# Altium project Tracker-NB-IOT-v1.0.PrjPcb (part 1 of 2)
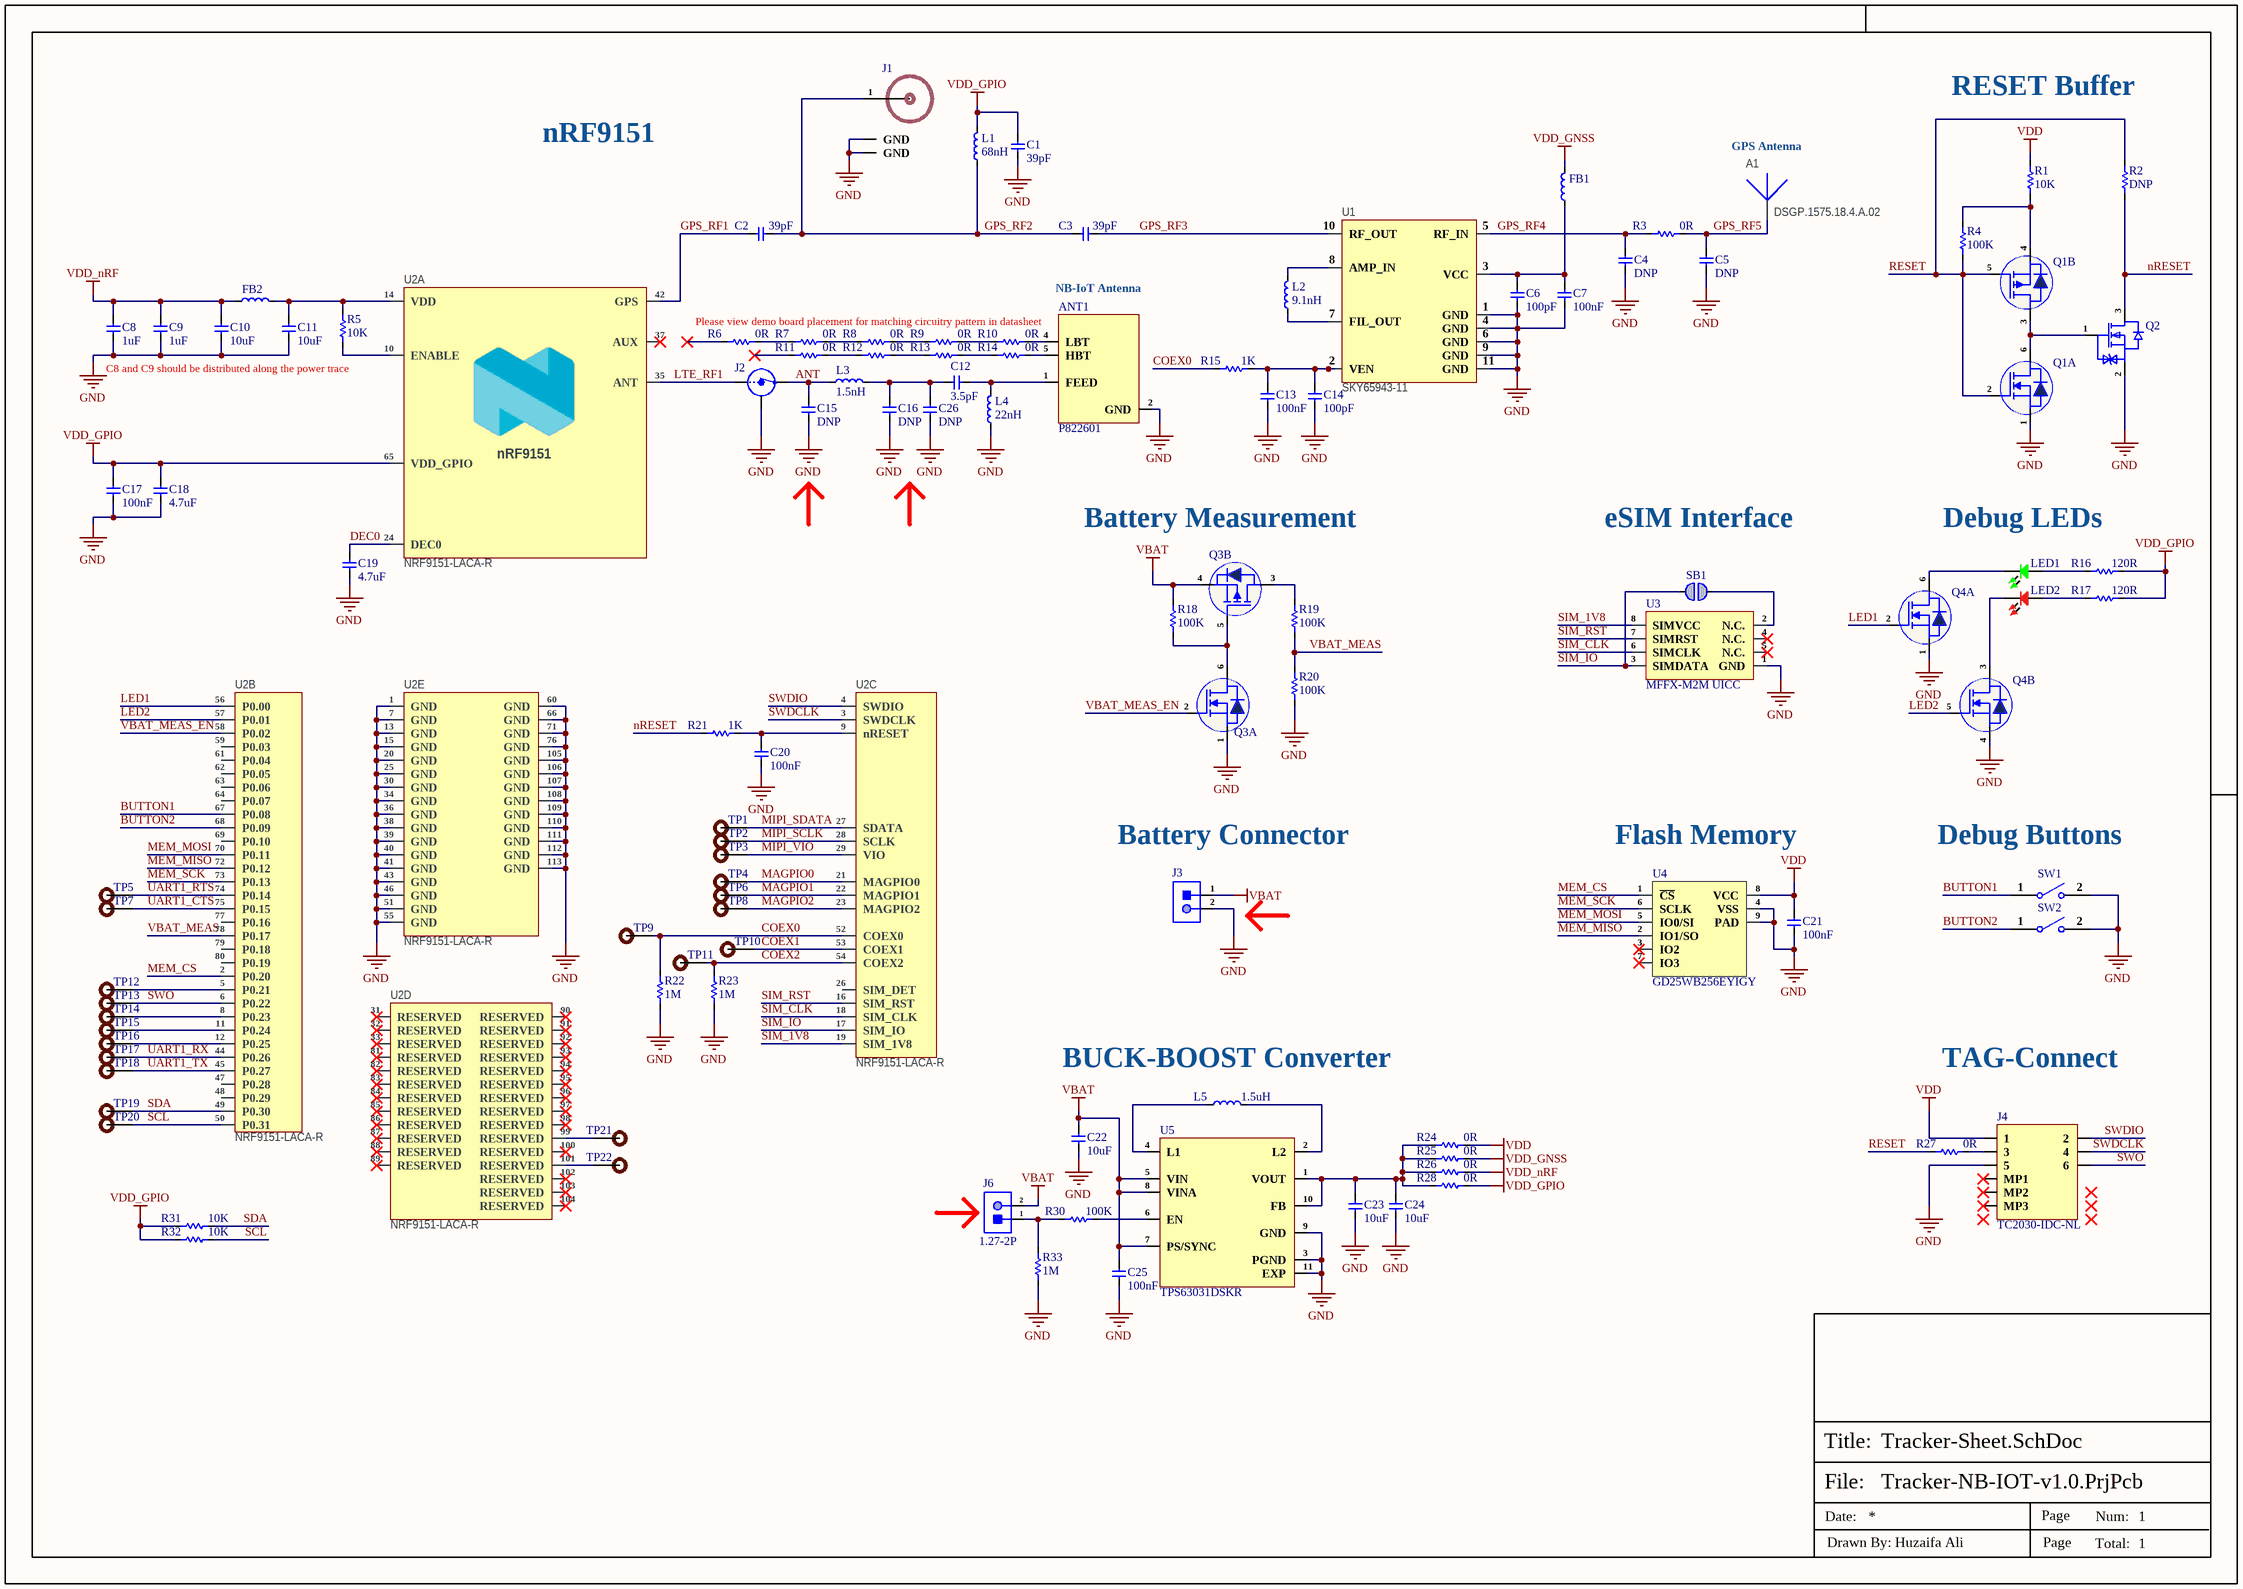
[diagram p0: Tracker-Sheet.SchDoc]
1 sheet, 108 parts. Net scope: global (net labels, ports and power ports of the same name join across sheets).
Board file: Tracker-NB-IOT-v1.0.PcbDoc

## Sheet Tracker-Sheet.SchDoc
size 420 x 297 mm; SheetNumber: 1; SheetTotal: 1

### Parts
A1  DSGP.1575.18.4.A.02  [DSGP.1575.18.4.A.02]
ANT1  P822601  [P822601]
C1  39pF  [Cap-0402]
C2  39pF  [Cap-0402]
C3  39pF  [Cap-0402]
C4  DNP  [Cap-0402]
C5  DNP  [Cap-0402]
C6  100pF  [CAP-0201]
C7  100nF  [CAP-0201]
C8  1uF  [CAP-0201]
C9  1uF  [CAP-0201]
C10  10uF  [Cap-0603]
C11  10uF  [Cap-0603]
C12  3.5pF  [CAP-0201]
C13  100nF  [CAP-0201]
C14  100pF  [CAP-0201]
C15  DNP  [CAP-0201]
C16  DNP  [CAP-0201]
C17  100nF  [CAP-0201]
C18  4.7uF  [Cap-0402]
C19  4.7uF  [Cap-0402]
C20  100nF  [CAP-0201]
C21  100nF  [CAP-0201]
C22  10uF  [Cap-0603]
C23  10uF  [Cap-0603]
C24  10uF  [Cap-0603]
C25  100nF  [CAP-0201]
C26  DNP  [CAP-0201]
FB1  BLM15EX121SN1D  [IND-0402]  (value not drawn)
FB2  BLM18SD220SN1D  [IND-0603 (1608 Metric)]  (value not drawn)
J1  U.FL-R-SMT-1(80)  [U.FL-R-SMT-1(80)_]  (value not drawn)
J2  MM8130-2600RA2  [MM8130-2600RA2]  (value not drawn)
J3  S2B-PH-SM4-TB(LF)(SN)  [S2B-PH-SM4-TB(LF)(SN)]  (value not drawn)
J4  TC2030-IDC-NL  [TC2030-IDC-NL_]
J6  1.27-2P  [HDR1X2 (R/A Male) 1.27mm Pitch]
L1  68nH  [IND-0402]
L2  9.1nH  [IND-0402]
L3  1.5nH  [IND-0201]
L4  22nH  [IND-0201]
L5  1.5uH  [LVT303012-1R5M-N]
LED1  Emerald  [LED-0603]  (value not drawn)
LED2  RED  [LED-0603]  (value not drawn)
Q1  DMC2400UV-7  [SOT-563]  (value not drawn)  (parts A,B of 2)
Q2  RV2C010UNT2L  [DFN1006-3]  (value not drawn)
Q3  NX1029X,115  [SOT-666]  (value not drawn)  (parts A,B of 2)
Q4  UM6X1NA-TP  [SOT-563]  (value not drawn)  (parts A,B of 2)
R1  10K  [Res-0201]
R2  DNP  [Res-0201]
R3  0R  [Res-0402]
R4  100K  [Res-0201]
R5  10K  [Res-0201]
R6  0R  [Res-0201]
R7  0R  [Res-0201]
R8  0R  [Res-0201]
R9  0R  [Res-0201]
R10  0R  [Res-0201]
R11  0R  [Res-0201]
R12  0R  [Res-0201]
R13  0R  [Res-0201]
R14  0R  [Res-0201]
R15  1K  [Res-0201]
R16  120R  [Res-0201]
R17  120R  [Res-0201]
R18  100K  [Res-0201]
R19  100K  [Res-0201]
R20  100K  [Res-0201]
R21  1K  [Res-0201]
R22  1M  [Res-0201]
R23  1M  [Res-0201]
R24  0R  [Res-0402]
R25  0R  [Res-0402]
R26  0R  [Res-0402]
R27  0R  [Res-0201]
R28  0R  [Res-0402]
R30  100K  [Res-0201]
R31  10K  [Res-0201]
R32  10K  [Res-0201]
R33  1M  [Res-0201]
SB1  Solder Bridge 0402  [Solder Bridge 0402]  (value not drawn)  (no BOM)
SW1  B3U-1000P  [B3U-1000P]  (value not drawn)
SW2  B3U-1000P  [B3U-1000P]  (value not drawn)
TP1  TEST POINT 0.5mm Dia  [Test-point - 0.5mm]  (value not drawn)  (no BOM)
TP2  TEST POINT 0.5mm Dia  [Test-point - 0.5mm]  (value not drawn)  (no BOM)
TP3  TEST POINT 0.5mm Dia  [Test-point - 0.5mm]  (value not drawn)  (no BOM)
TP4  TEST POINT 0.5mm Dia  [Test-point - 0.5mm]  (value not drawn)  (no BOM)
TP5  TEST POINT 0.5mm Dia  [Test-point - 0.5mm]  (value not drawn)  (no BOM)
TP6  TEST POINT 0.5mm Dia  [Test-point - 0.5mm]  (value not drawn)  (no BOM)
TP7  TEST POINT 0.5mm Dia  [Test-point - 0.5mm]  (value not drawn)  (no BOM)
TP8  TEST POINT 0.5mm Dia  [Test-point - 0.5mm]  (value not drawn)  (no BOM)
TP9  TEST POINT 0.5mm Dia  [Test-point - 0.5mm]  (value not drawn)  (no BOM)
TP10  TEST POINT 0.5mm Dia  [Test-point - 0.5mm]  (value not drawn)  (no BOM)
TP11  TEST POINT 0.5mm Dia  [Test-point - 0.5mm]  (value not drawn)  (no BOM)
TP12  TEST POINT 0.5mm Dia  [Test-point - 0.5mm]  (value not drawn)  (no BOM)
TP13  TEST POINT 0.5mm Dia  [Test-point - 0.5mm]  (value not drawn)  (no BOM)
TP14  TEST POINT 0.5mm Dia  [Test-point - 0.5mm]  (value not drawn)  (no BOM)
TP15  TEST POINT 0.5mm Dia  [Test-point - 0.5mm]  (value not drawn)  (no BOM)
TP16  TEST POINT 0.5mm Dia  [Test-point - 0.5mm]  (value not drawn)  (no BOM)
TP17  TEST POINT 0.5mm Dia  [Test-point - 0.5mm]  (value not drawn)  (no BOM)
TP18  TEST POINT 0.5mm Dia  [Test-point - 0.5mm]  (value not drawn)  (no BOM)
TP19  TEST POINT 0.5mm Dia  [Test-point - 0.5mm]  (value not drawn)  (no BOM)
TP20  TEST POINT 0.5mm Dia  [Test-point - 0.5mm]  (value not drawn)  (no BOM)
TP21  TEST POINT 0.5mm Dia  [Test-point - 0.5mm]  (value not drawn)  (no BOM)
TP22  TEST POINT 0.5mm Dia  [Test-point - 0.5mm]  (value not drawn)  (no BOM)
U1  SKY65943-11  [10-MCM (2.5x2.5)]
U2  NRF9151-LACA-R  [NRF9151-LACA-R]  (parts A,B,C,D,E of 5)
U3  MFFX-M2M UICC  [MFFX]
U4  GD25WB256EYIGY  [8-WSON (8x6)]
U5  TPS63031DSKR  [10-SON (2.5x2.5)]

### Nets
GND: A1.2(GND) ANT1.2(GND) C1.1 C4.2 C5.2 C6.1 C7.1 C8.1 C9.1 C10.1 C11.1 C13.1 C14.1 C15.1 C16.1 C17.1 C18.1 C19.1 C20.1 C21.1 C22.1 C23.1 C24.1 C25.1 C26.1 J1.2(GND) J1.3(GND) J2.3(Shield) J3.2 J4.5 L4.1 Q1.1(S1) Q2.2(S) Q3.1(S1) Q4.1(S1) Q4.4(S4) R20.1 R22.1 R23.1 R33.1 SW1.2 SW2.2 U1.1(GND) U1.4(GND) U1.6(GND) U1.9(GND) U1.11(GND) U2.1(GND) U2.7(GND) U2.13(GND) U2.15(GND) U2.20(GND) U2.25(GND) U2.30(GND) U2.34(GND) U2.36(GND) U2.38(GND) U2.39(GND) U2.40(GND) U2.41(GND) U2.43(GND) U2.46(GND) U2.51(GND) U2.55(GND) U2.60(GND) U2.66(GND) U2.71(GND) U2.76(GND) U2.105(GND) U2.106(GND) U2.107(GND) U2.108(GND) U2.109(GND) U2.110(GND) U2.111(GND) U2.112(GND) U2.113(GND) U3.1(GND) U4.4(VSS) U4.9(PAD) U5.3(PGND) U5.9(GND) U5.11(EXP)
VBAT: C22.2 C25.2 J3.1 J6.2 Q3.4(S2) R18.2 U5.5(VIN) U5.7(PS/SYNC) U5.8(VINA)
VDD: C21.2 J4.1 R1.2 R24.2 U4.8(VCC)
VDD_GNSS: FB1.2 R25.2
VDD_GPIO: C1.2 C17.2 C18.2 L1.2 R16.2 R17.2 R28.2 R31.2 R32.2 U2.65(VDD_GPIO)
VDD_nRF: C8.2 C9.2 C10.2 FB2.1 R26.2
ANT: C15.2 J2.2(OUT) L3.1
BUTTON1: SW1.1 U2.67(P0.08)
BUTTON2: SW2.1 U2.68(P0.09)
COEX0: R15.1 R22.2 TP9.1 U2.52(COEX0)
COEX1: TP10.1 U2.53(COEX1)
COEX2: R23.2 TP11.1 U2.54(COEX2)
DEC0: C19.2 U2.24(DEC0)
GPS_RF1: C2.1 U2.42(GPS)
GPS_RF2: C2.2 C3.2 J1.1(RF_IN) L1.1
GPS_RF3: C3.1 U1.10(RF_OUT)
GPS_RF4: C4.1 R3.1 U1.5(RF_IN)
GPS_RF5: A1.1 C5.1 R3.2
LED1: Q4.2(G1) U2.56(P0.00)
LED2: Q4.5(G2) U2.57(P0.01)
LTE_RF1: J2.1(IN) U2.35(ANT)
MAGPIO0: TP4.1 U2.21(MAGPIO0)
MAGPIO1: TP6.1 U2.22(MAGPIO1)
MAGPIO2: TP8.1 U2.23(MAGPIO2)
MEM_CS: U2.2(P0.20) U4.1(~{CS})
MEM_MISO: U2.72(P0.12) U4.2(IO1/SO)
MEM_MOSI: U2.70(P0.11) U4.5(IO0/SI)
MEM_SCK: U2.73(P0.13) U4.6(SCLK)
MIPI_SCLK: TP2.1 U2.28(SCLK)
MIPI_SDATA: TP1.1 U2.27(SDATA)
MIPI_VIO: TP3.1 U2.29(VIO)
nRESET: Q2.3(D) R2.1 R21.1
RESET: Q1.2(G1) Q1.5(G2) R2.2 R4.1 R27.1
SCL: R32.1 TP20.1 U2.50(P0.31)
SDA: R31.1 TP19.1 U2.49(P0.30)
SIM_1V8: U2.19(SIM_1V8) U3.8(SIMVCC)
SIM_CLK: U2.18(SIM_CLK) U3.6(SIMCLK)
SIM_IO: SB1.2 U2.17(SIM_IO) U3.3(SIMDATA)
SIM_RST: U2.16(SIM_RST) U3.7(SIMRST)
SWDCLK: J4.4 U2.3(SWDCLK)
SWDIO: J4.2 U2.4(SWDIO)
SWO: J4.6 TP13.1 U2.6(P0.22)
UART1_CTS: TP7.1 U2.75(P0.15)
UART1_RTS: TP5.1 U2.74(P0.14)
UART1_RX: TP17.1 U2.44(P0.26)
UART1_TX: TP18.1 U2.45(P0.27)
VBAT_MEAS: R19.1 R20.2 U2.78(P0.17)
VBAT_MEAS_EN: Q3.2(G1) U2.58(P0.02)
NetANT1_1: ANT1.1(FEED) C12.2 L4.2
NetANT1_4: ANT1.4(LBT) R10.2
NetANT1_5: ANT1.5(HBT) R14.2
NetC6_2: C6.2 C7.2 FB1.1 U1.3(VCC)
NetC11_2: C11.2 FB2.2 R5.2 U2.14(VDD)
NetC12_1: C12.1 C16.2 C26.2 L3.2
NetC13_2: C13.2 C14.2 R15.2 U1.2(VEN)
NetC20_2: C20.2 R21.2 U2.9(nRESET)
NetC23_2: C23.2 C24.2 R24.1 R25.1 R26.1 R28.1 U5.1(VOUT) U5.10(FB)
NetJ4_3: J4.3 R27.2
NetJ6_1: J6.1 R30.2 R33.2
NetL2_1: L2.1 U1.7(FIL_OUT)
NetL2_2: L2.2 U1.8(AMP_IN)
NetL5_1: L5.1 U5.4(L1)
NetL5_2: L5.2 U5.2(L2)
NetLED1_1: LED1.1 R16.1
NetLED1_2: LED1.2 Q4.6(D1)
NetLED2_1: LED2.1 R17.1
NetLED2_2: LED2.2 Q4.3(D2)
NetQ1_3: Q1.3(D2) Q1.6(D1) Q2.1(G)
NetQ1_4: Q1.4(S2) R1.1 R4.2
NetQ3_3: Q3.3(D2) R19.2
NetQ3_5: Q3.5(G2) Q3.6(D1) R18.1
NetR5_1: R5.1 U2.10(ENABLE)
NetR6_2: R6.2 R7.1
NetR7_2: R7.2 R8.1
NetR8_2: R8.2 R9.1
NetR9_2: R9.2 R10.1
NetR11_2: R11.2 R12.1
NetR12_2: R12.2 R13.1
NetR13_2: R13.2 R14.1
NetR30_1: R30.1 U5.6(EN)
NetSB1_1: SB1.1 U3.2(N.C.)
NetTP12_1: TP12.1 U2.5(P0.21)
NetTP14_1: TP14.1 U2.8(P0.23)
NetTP15_1: TP15.1 U2.11(P0.24)
NetTP16_1: TP16.1 U2.12(P0.25)
NetTP21_1: TP21.1 U2.99(RESERVED)
NetTP22_1: TP22.1 U2.101(RESERVED)

Not connected (* = marked no-connect by the designer): J4 MP1* MP2* MP3*; R6 1*; R11 1*; U2 26(SIM_DET) 31(RESERVED)* 32(RESERVED)* 33(RESERVED)* 37(AUX)* 47(P0.28) 48(P0.29) 59(P0.03) 61(P0.04) 62(P0.05) 63(P0.06) 64(P0.07) 69(P0.10) 77(P0.16) 79(P0.18) 80(P0.19) 81(RESERVED)* 82(RESERVED)* 83(RESERVED)* 84(RESERVED)* 85(RESERVED)* 86(RESERVED)* 87(RESERVED)* 88(RESERVED)* 89(RESERVED)* 90(RESERVED)* 91(RESERVED)* 92(RESERVED)* 93(RESERVED)* 94(RESERVED)* 95(RESERVED)* 96(RESERVED)* 97(RESERVED)* 98(RESERVED)* 100(RESERVED)* 102(RESERVED)* 103(RESERVED)* 104(RESERVED)*; U3 4(N.C.)* 5(N.C.)*; U4 3(IO2)* 7(IO3)*

### Notes on the sheet
- nRF9151
- RESET Buffer
- (near A1) GPS Antenna
- Please view demo board placement for matching circuitry pattern in datasheet
- NB-IoT Antenna
- C8 and C9 should be distributed along the power trace
- Battery Measurement
- eSIM Interface
- Debug LEDs
- (near J3) Battery Connector
- Flash Memory
- (near SW1) Debug Buttons
- (near L5) BUCK-BOOST Converter
- TAG-Connect
- File:
- Title:
- Date:
- Page
- Num:
- Total:
- Drawn By: Huzaifa Ali
- (in symbol NPM1300-QEAA-R) nPM1300
- (in symbol NRF9151-LACA-R, part A) nRF9151